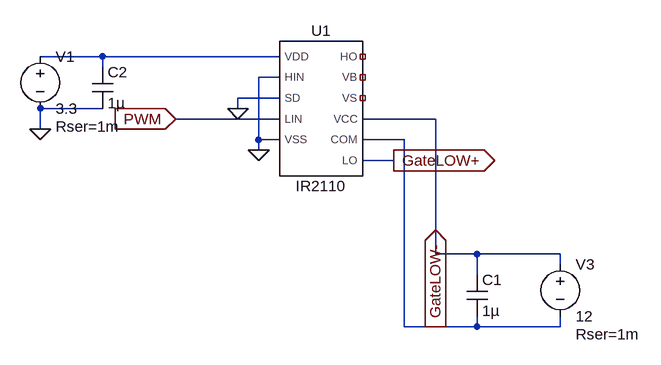
[diagram p0: schematic GateDriver.asc]
GateDriver.asc, the LTspice schematic file:
Version 4.1
SHEET 1 1208 680
WIRE -128 80 -224 80
WIRE 144 80 -128 80
WIRE -128 96 -128 80
WIRE 144 112 112 112
WIRE 144 144 80 144
WIRE -128 160 -224 160
WIRE 80 160 80 144
WIRE 144 176 -16 176
WIRE 384 176 272 176
WIRE -224 192 -224 160
WIRE 112 208 112 112
WIRE 144 208 112 208
WIRE 336 208 272 208
WIRE 112 224 112 208
WIRE 320 240 272 240
WIRE 384 384 384 176
WIRE 448 384 384 384
WIRE 576 384 448 384
WIRE 576 400 576 384
WIRE 448 416 448 384
WIRE 336 496 336 208
WIRE 384 496 336 496
WIRE 448 496 448 480
WIRE 448 496 384 496
WIRE 576 496 576 480
WIRE 576 496 448 496
FLAG -224 192 0
FLAG 112 224 0
FLAG 80 160 0
FLAG 384 496 GateLOW-
IOPIN 384 496 Out
FLAG -16 176 PWM
IOPIN -16 176 In
FLAG 320 240 GateLOW+
IOPIN 320 240 Out
SYMBOL IR2110 208 160 R0
SYMATTR InstName U1
SYMBOL voltage -224 64 R0
WINDOW 123 0 0 Left 0
WINDOW 39 24 124 Left 2
SYMATTR SpiceLine Rser=1m
SYMATTR InstName V1
SYMATTR Value 3.3
SYMBOL voltage 576 384 R0
WINDOW 123 0 0 Left 0
WINDOW 39 24 124 Left 2
SYMATTR SpiceLine Rser=1m
SYMATTR InstName V3
SYMATTR Value 12
SYMBOL cap 432 416 R0
SYMATTR InstName C1
SYMATTR Value 1µ
SYMBOL cap -144 96 R0
SYMATTR InstName C2
SYMATTR Value 1µ

The netlist it stands for:
* GateDriver.asc
X§U1 GateLOW+ NC_01 GateLOW- 0 PWM 0 N002 NC_02 NC_03 N001 0 IR2110  ; pins LO HO COM VSS LIN HIN VCC VB VS VDD SD
V1 N001 0 3.3 Rser=1m
V3 N002 GateLOW- 12 Rser=1m
C1 N002 GateLOW- 1µ
C2 N001 0 1µ
.lib C:\Users\Davide Catania\Desktop\Erasmus\tesi\RE_ LIGH2TDRONE Project\spice\Boost Real-New 0603\IR2110.lib
.backanno
.end